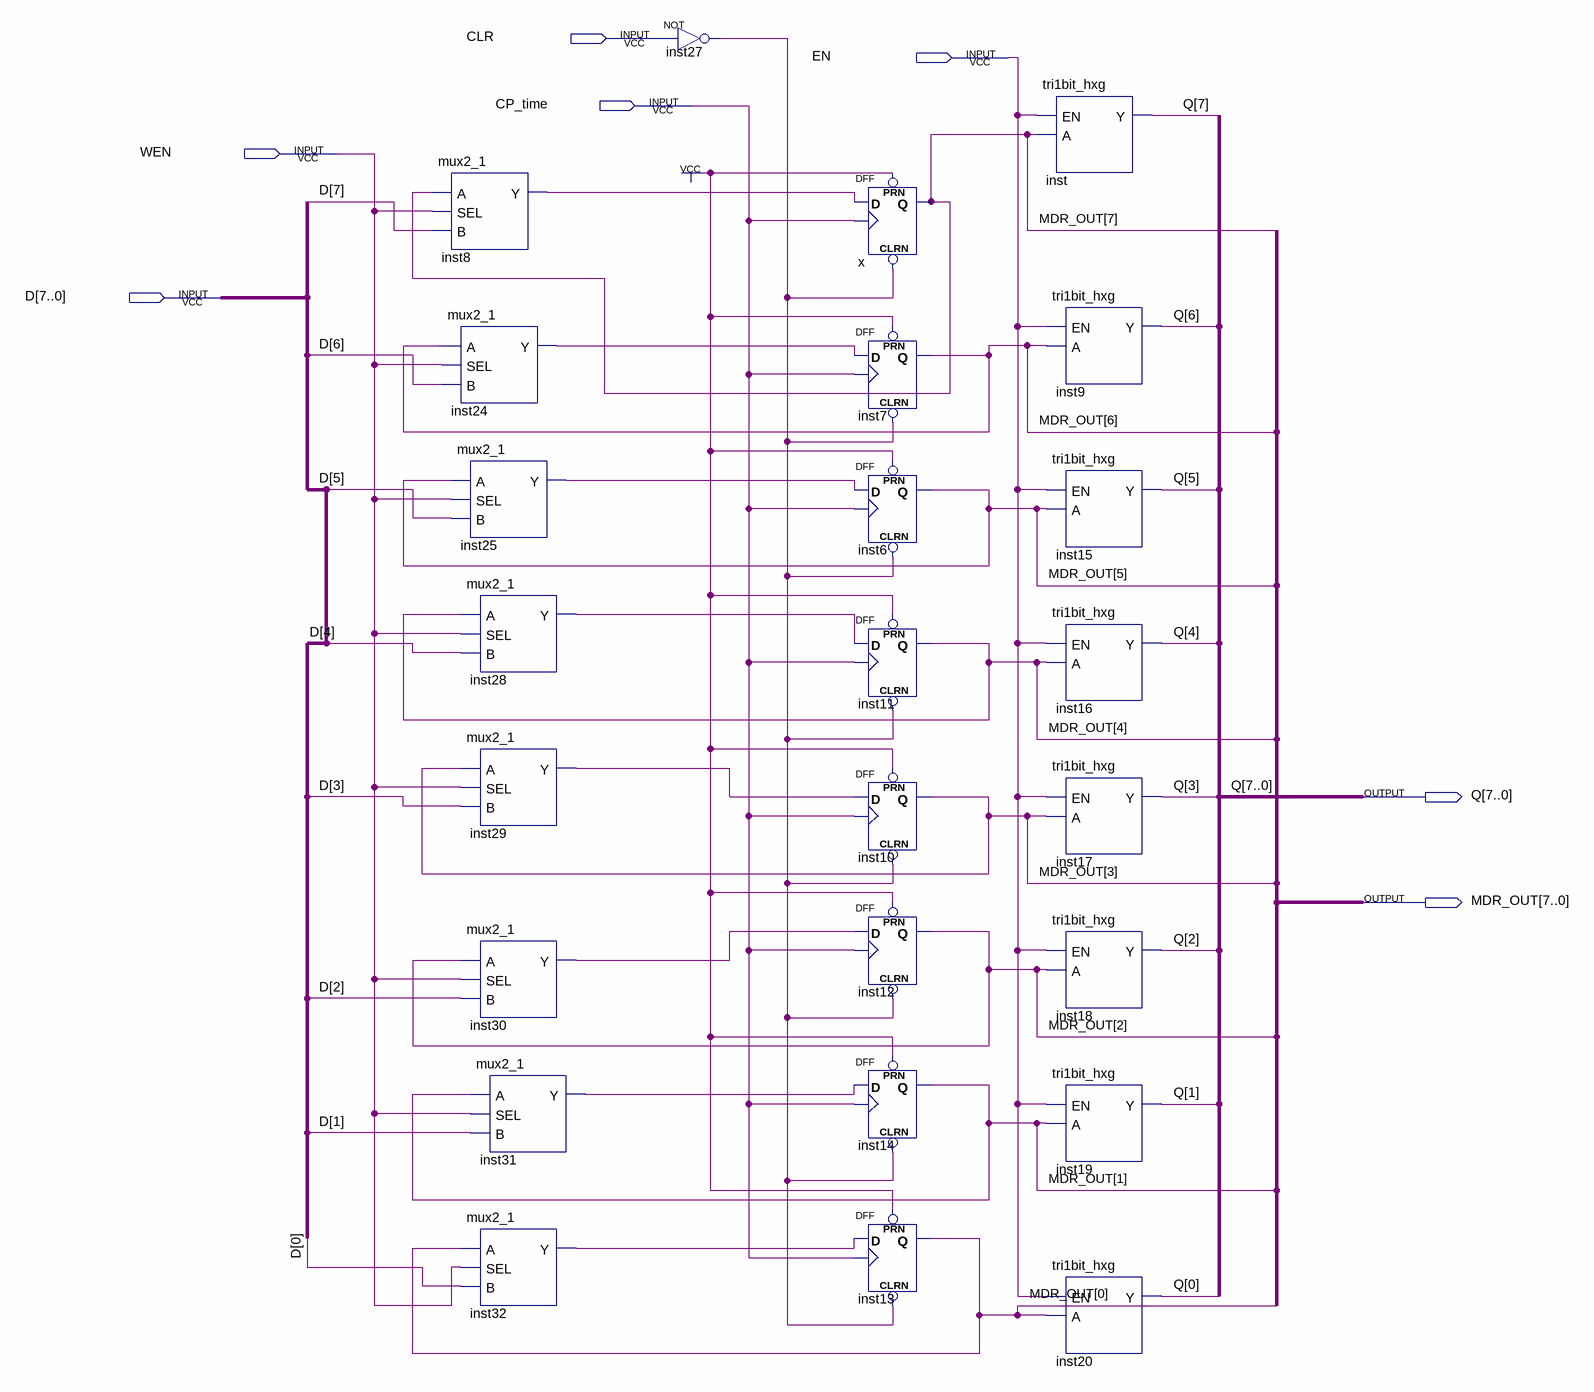
[diagram p0: schematic sheet]
// Quartus schematic MDR_hxg.bdf as structural Verilog: 25 symbols, 7 pins
module MDR_hxg (
  input  CLR,
  input  EN,
  input  CP_time,
  input  WEN,
  input  [7:0] D,
  output [7:0] Q,
  output [7:0] MDR_OUT
);

  wire inst8_y, inst24_y, inst25_y, inst27_out, inst28_y, inst29_y, inst30_y, inst31_y, inst32_y;

  mux2_1 inst8 (.A(MDR_OUT[7]), .SEL(WEN), .B(D[7]), .Y(inst8_y));
  mux2_1 inst24 (.A(MDR_OUT[6]), .SEL(WEN), .B(D[6]), .Y(inst24_y));
  mux2_1 inst25 (.A(MDR_OUT[5]), .SEL(WEN), .B(D[5]), .Y(inst25_y));
  mux2_1 inst28 (.A(MDR_OUT[4]), .SEL(WEN), .B(D[4]), .Y(inst28_y));
  mux2_1 inst29 (.A(MDR_OUT[3]), .SEL(WEN), .B(D[3]), .Y(inst29_y));
  mux2_1 inst30 (.A(MDR_OUT[2]), .SEL(WEN), .B(D[2]), .Y(inst30_y));
  mux2_1 inst31 (.A(MDR_OUT[1]), .SEL(WEN), .B(D[1]), .Y(inst31_y));
  mux2_1 inst32 (.A(MDR_OUT[0]), .SEL(WEN), .B(D[0]), .Y(inst32_y));
  not inst27 (inst27_out, CLR);
  DFF x (.CLRN(inst27_out), .CLK(CP_time), .D(inst8_y), .PRN(1'b1), .Q(MDR_OUT[7]));
  DFF inst7 (.CLRN(inst27_out), .CLK(CP_time), .D(inst24_y), .PRN(1'b1), .Q(MDR_OUT[6]));
  DFF inst6 (.CLRN(inst27_out), .CLK(CP_time), .D(inst25_y), .PRN(1'b1), .Q(MDR_OUT[5]));
  DFF inst11 (.CLRN(inst27_out), .CLK(CP_time), .D(inst28_y), .PRN(1'b1), .Q(MDR_OUT[4]));
  DFF inst10 (.CLRN(inst27_out), .CLK(CP_time), .D(inst29_y), .PRN(1'b1), .Q(MDR_OUT[3]));
  DFF inst12 (.CLRN(inst27_out), .CLK(CP_time), .D(inst30_y), .PRN(1'b1), .Q(MDR_OUT[2]));
  DFF inst14 (.CLRN(inst27_out), .CLK(CP_time), .D(inst31_y), .PRN(1'b1), .Q(MDR_OUT[1]));
  DFF inst13 (.CLRN(inst27_out), .CLK(CP_time), .D(inst32_y), .PRN(1'b1), .Q(MDR_OUT[0]));
  tri1bit_hxg inst (.EN(EN), .A(MDR_OUT[7]), .Y(Q[7]));
  tri1bit_hxg inst9 (.EN(EN), .A(MDR_OUT[6]), .Y(Q[6]));
  tri1bit_hxg inst15 (.EN(EN), .A(MDR_OUT[5]), .Y(Q[5]));
  tri1bit_hxg inst16 (.EN(EN), .A(MDR_OUT[4]), .Y(Q[4]));
  tri1bit_hxg inst17 (.EN(EN), .A(MDR_OUT[3]), .Y(Q[3]));
  tri1bit_hxg inst18 (.EN(EN), .A(MDR_OUT[2]), .Y(Q[2]));
  tri1bit_hxg inst19 (.EN(EN), .A(MDR_OUT[1]), .Y(Q[1]));
  tri1bit_hxg inst20 (.EN(EN), .A(MDR_OUT[0]), .Y(Q[0]));
endmodule
